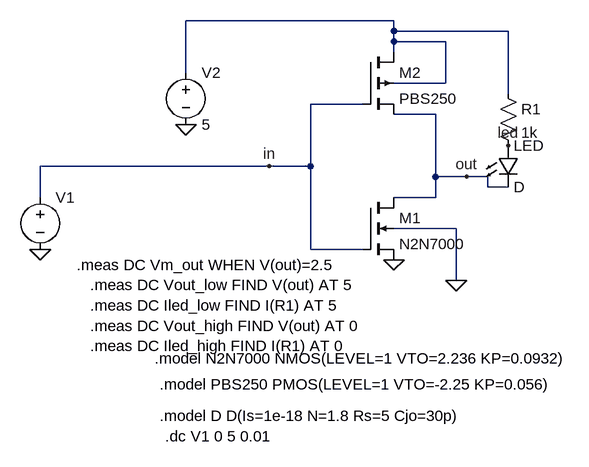
[diagram p0: schematic LTS_E52.asc]
LTS_E52.asc, the LTspice schematic file:
Version 4
SHEET 1 880 680
WIRE 240 -80 -80 -80
WIRE 240 -64 240 -80
WIRE 416 -64 240 -64
WIRE 240 -48 240 -64
WIRE 320 -48 240 -48
WIRE 240 -32 240 -48
WIRE -80 0 -80 -80
WIRE 320 16 320 -48
WIRE 320 16 240 16
WIRE 416 32 416 -64
WIRE 192 48 112 48
WIRE 304 64 240 64
WIRE 48 144 -304 144
WIRE 112 144 112 48
WIRE 112 144 48 144
WIRE 304 160 304 64
WIRE 352 160 304 160
WIRE 384 160 352 160
WIRE 384 176 384 160
WIRE 416 176 384 176
WIRE -304 192 -304 144
WIRE 304 192 304 160
WIRE 304 192 240 192
WIRE 336 240 240 240
WIRE 112 272 112 144
WIRE 192 272 112 272
WIRE 336 320 336 240
FLAG 240 288 0
FLAG -80 80 0
FLAG 336 320 0
FLAG 48 144 in
FLAG -304 272 0
FLAG 416 112 led
FLAG 352 160 out
SYMBOL nmos4 192 192 R0
SYMATTR InstName M1
SYMATTR Value N2N7000
SYMBOL pmos4 192 -32 R0
SYMATTR InstName M2
SYMATTR Value PBS250
SYMBOL voltage -304 176 R0
WINDOW 123 0 0 Left 0
WINDOW 39 0 0 Left 0
WINDOW 3 24 44 Left 2
SYMATTR Value ""
SYMATTR InstName V1
SYMBOL res 400 16 R0
SYMATTR InstName R1
SYMATTR Value 1k
SYMBOL LED 400 112 R0
SYMATTR InstName LED
SYMBOL voltage -80 -16 R0
WINDOW 123 0 0 Left 0
WINDOW 39 0 0 Left 0
SYMATTR InstName V2
SYMATTR Value 5
TEXT -128 440 Left 2 !.model N2N7000 NMOS(LEVEL=1 VTO=2.236 KP=0.0932)
TEXT -120 480 Left 2 !.model PBS250 PMOS(LEVEL=1 VTO=-2.25 KP=0.056)
TEXT -120 528 Left 2 !.model D D(Is=1e-18 N=1.8 Rs=5 Cjo=30p)
TEXT -112 560 Left 2 !.dc V1 0 5 0.01
TEXT -248 296 Left 2 !.meas DC Vm_out WHEN V(out)=2.5\n   .meas DC Vout_low FIND V(out) AT 5\n   .meas DC Iled_low FIND I(R1) AT 5\n   .meas DC Vout_high FIND V(out) AT 0\n   .meas DC Iled_high FIND I(R1) AT 0

The netlist it stands for:
* LTS_E52.asc
M1 out in 0 0 N2N7000
M2 N001 in out N001 PBS250
V1 in 0
R1 N001 led 1k
D§LED led out D
V2 N001 0 5
.model D D
.lib standard.dio
.model NMOS NMOS
.model PMOS PMOS
.lib standard.mos
.model N2N7000 NMOS(LEVEL=1 VTO=2.236 KP=0.0932)
.model PBS250 PMOS(LEVEL=1 VTO=-2.25 KP=0.056)
.model D D(Is=1e-18 N=1.8 Rs=5 Cjo=30p)
.dc V1 0 5 0.01
.meas DC Vm_out WHEN V(out)=2.5
   .meas DC Vout_low FIND V(out) AT 5
   .meas DC Iled_low FIND I(R1) AT 5
   .meas DC Vout_high FIND V(out) AT 0
   .meas DC Iled_high FIND I(R1) AT 0
.backanno
.end

* Results of the author's LTspice run, read from the files saved beside the schematic
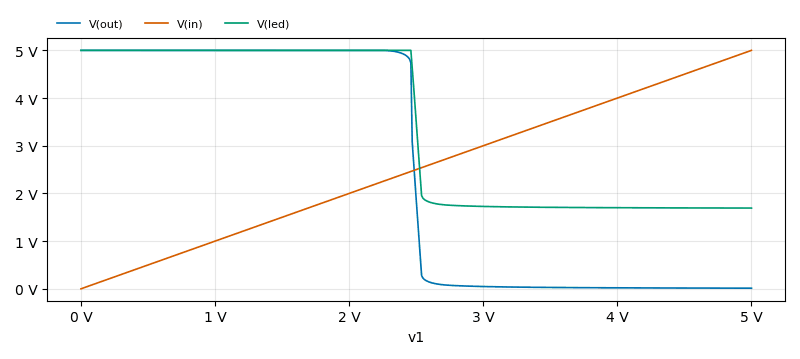
[diagram p1: DC transfer characteristic of LTS_E52.asc, plotted from the saved traces]
* DC transfer characteristic, 1 run:
*   V(out): 5 V at v1=0 V, 12.87 mV at v1=5 V, min 12.87 mV, max 5 V
*   V(in): 0 V at v1=0 V, 5 V at v1=5 V, min 0 V, max 5 V
*   V(led): 5 V at v1=0 V, 1.693 V at v1=5 V, min 1.693 V, max 5 V
* From the log:
*   vm_out: v(out)=2.5 AT 2.4842
*   vout_low: v(out)=0.012867 at 5
*   iled_low: i(r1)=0.0033069 at 5
*   vout_high: v(out)=5 at 0
*   iled_high: i(r1)=2.04281e-016 at 0